# Altium schematic sheet POWER.SchDoc
size A4; SheetNumber: 2; SheetTotal: 2
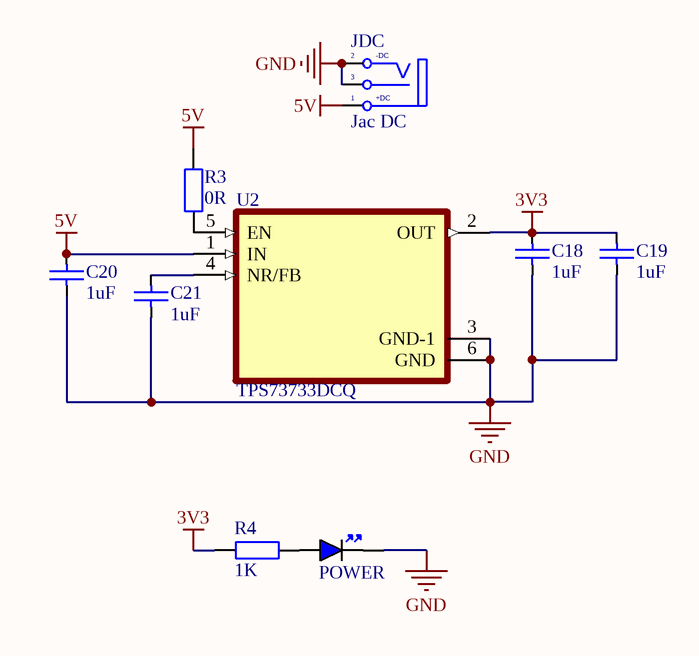
[diagram p0: POWER.SchDoc]

## Parts
C18  1uF  [CAP_0805]
C19  1uF  [CAP_0805]
C20  1uF  [CAP_0805]
C21  1uF  [CAP_0805]
JDC  Jac DC  [DC-IN]
POWER  BLUE  [LED_0805_BLUE]  (value not drawn)
R3  0R  [RES-SMD-0805]
R4  1K  [SM-0805]
U2  TPS73733DCQ  [SOT127P706X180-6N]

## Nets
3V3: C18.2 C19.2 R4.1 U2.2(OUT)
5V: C20.2 JDC.1(T) R3.1 U2.1(IN)
GND: C18.1 C19.1 C20.1 C21.1 JDC.2(TN) JDC.3(S) POWER.K U2.3(GND-1) U2.6(GND)
NetC21_2: C21.2 U2.4(NR/FB)
NetPOWER_A: POWER.A R4.2
NetR3_2: R3.2 U2.5(EN)

## Notes on the sheet
- (in symbol DCIN) -DC; +DC

## Library data of the parts
C18-C21 = CapSMD: Capacitor; Value: 33p; Published: 8-Jun-2000; LatestRevisionDate: 17-Jul-2002; LatestRevisionNote: Re-released for DXP Platform.; PackageReference: RAD-0.3; Publisher: Altium Limited
JDC = DCIN: Jac DC input; Value: Jac DC
POWER = LED_0805_BLUE: LED 0805 BLUE SMD; Manufacturer: *; Manufacturer Part Number: *; Distributor Link: *; LCSC: *
R3 = Resistor - SMD: Resistor SMD; Manufacturer: Generic Components; Class: Passive; Published: 08/06/2000; Publisher: Altium Hobart Technology Centre
R4 = RM: Resistor SMD; Value: 1K
U2 = TPS73733DCQ: 1-A, ultra-low-dropout voltage regulator with reverse current protection & enable; MF: Texas Instruments; SnapEDA_Link: https://www.snapeda.com/parts/TPS73733DCQ/Texas+Instruments/view-part/?ref=snap; Package: SOT-223-6 Texas Instruments; Value: *; MP: TPS73733DCQ; Check_prices: https://www.snapeda.com/parts/TPS73733DCQ/Texas+Instruments/view-part/?ref=eda